# Altium schematic sheet Audi_In.SchDoc
size A4; CompanyName: HEPL; Engineer: CBR; Address1: Quai Gloesener 6; Address2: 4020, liege; SheetNumber: 3; SheetTotal: 5; Version: 1.0
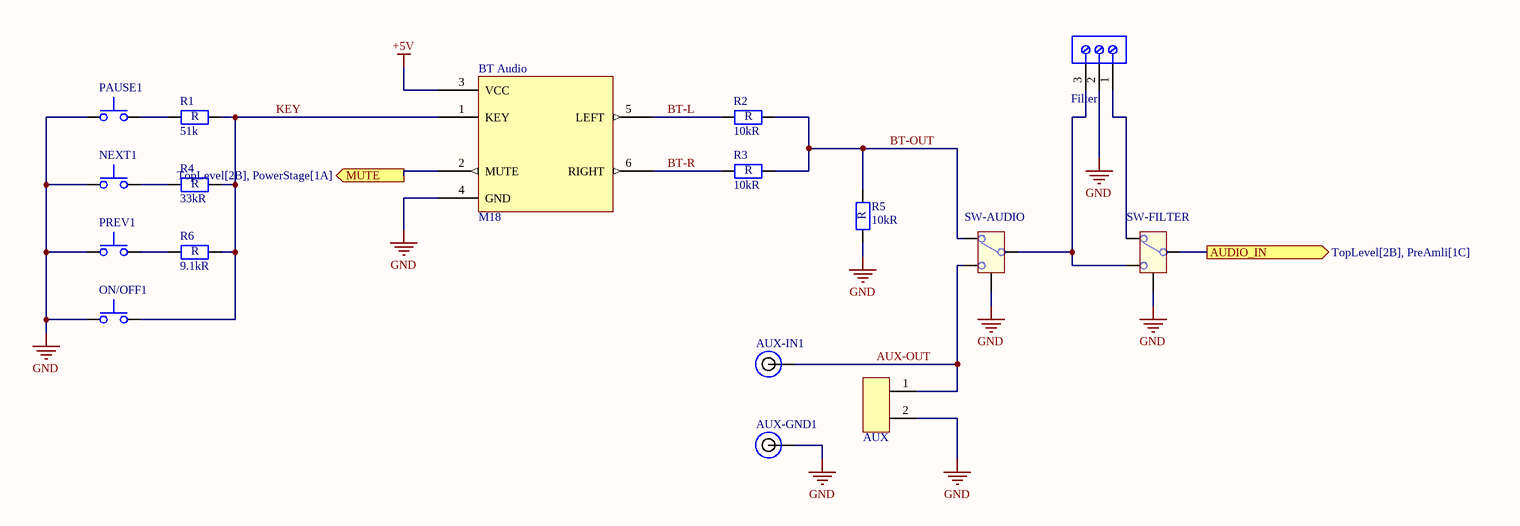
[diagram p0: Audi_In.SchDoc]

## Parts
AUX  (no value)  [TS-75x70]
AUX-GND1  (no value)  [Test Point 1.32mm]
AUX-IN1  (no value)  [Test Point 1.32mm]
BT_Audio  M18  [Bluetooth-M18 flat]
Filter  val?  [691214110003]  (value not drawn)
NEXT1  (no value)  [TackS-35X60]
ON/OFF1  (no value)  [TackS-35X60]
PAUSE1  (no value)  [TackS-35X60]
PREV1  (no value)  [TackS-35X60]
R1  51k  [1206-R]
R2  10kR  [1206-R]
R3  10kR  [1206-R]
R4  33kR  [1206-R]
R5  10kR  [1206-R]
R6  9.1kR  [1206-R]
SW-AUDIO  (no value)  [SPDT-OS102011MS2QN1]
SW-FILTER  (no value)  [SPDT-OS102011MS2QN1]

## Ports
AUDIO_IN (out, see TopLevel[2B], PreAmli[1C]), MUTE (out, see TopLevel[2B], PowerStage[1A])

## Nets
+5V: BT_Audio.3(VCC)
GND: AUX.2 AUX-GND1.1 BT_Audio.4(GND) Filter.2 NEXT1.1 ON/OFF1.1 PAUSE1.1 PREV1.1 R5.1 SW-AUDIO.4(shield) SW-FILTER.4(shield)
AUDIO_IN: SW-FILTER.2(C) ; port AUDIO_IN
AUX-OUT: AUX.1 AUX-IN1.1 SW-AUDIO.3(NO)
BT-L: BT_Audio.5(LEFT) R2.1
BT-OUT: R2.2 R3.2 R5.2 SW-AUDIO.1(NC)
BT-R: BT_Audio.6(RIGHT) R3.1
KEY: BT_Audio.1(KEY) ON/OFF1.2 R1.2 R4.2 R6.2
MUTE: BT_Audio.2(MUTE) ; port MUTE
NetFilter_1: Filter.1 SW-FILTER.1(NC)
NetFilter_3: Filter.3 SW-AUDIO.2(C) SW-FILTER.3(NO)
NetNEXT1_2: NEXT1.2 R4.1
NetPAUSE1_2: PAUSE1.2 R1.1
NetPREV1_2: PREV1.2 R6.1

## Notes on the sheet
- Title :
- HEPL
- Size :
- Date :
- A4
- sheet name :
- Time :
- Sheet
- of
- Engineer :
- Quai Gloesener
- 4020 Liège
- Version :
- (in symbol Resistor) R

## Library data of the parts
AUX = Connector-2: Fixed Terminal Blocks PT 1.5/2-3.5H 2POS HRZ 3.5mm SCREW; Manufacturer: Phoenix Contact; Manufacturer Part Number: 1984617; Supplier: Mouser; Supplier Part Number: 651-1984617; Supplier Unit Price: 0.55; MOQ: 1
AUX-GND1 AUX-IN1 = Test Point: PCB Test Point, Type 8 Series, Black, Through Hole Mount, 1.32 mm, Phosphor Bronze; Manufacturer: VERO; Manufacturer Part Number: 20-2136; Supplier Part Number: 8731195; Supplier: Farnell; Supplier Unit Price: 0.132; MOQ: 100
BT_Audio = M18-Bluetooth: BLUETOOTH AUDIO TRANSFER MODULE; Manufacturer: *; Manufacturer Part Number: *; Supplier: *; Supplier Part Number: *; Supplier Unit Price: *; MOQ: *
Filter = Screw Terminal 3x: Manufacturer: WE; Manufacturer Part Number: 691-214110-003; Supplier: mouser; Supplier Part Number: 710-691214110003; Supplier Unit Price: 1.16; MOQ: 1
NEXT1 ON/OFF1 PAUSE1 PREV1 = TackSwitch Simple: Manufacturer: MULTICOMP PRO; Manufacturer Part Number: DTSM-32S-B; Supplier Part Number: 9471898; Supplier: Farnell; Supplier Unit Price: 0.188; MOQ: 10
R1-R6 = Resistor: Manufacturer: *; Manufacturer Part Number: *; Supplier: *; Supplier Part Number: *; Supplier Unit Price: *; MOQ: *
SW-AUDIO SW-FILTER = SPDT: Slide Switches SPDT On-On; Manufacturer: C&K; Manufacturer Part Number: OS102011MS2QN1; Supplier: Mouser; Supplier Part Number: 611-OS102011MS2QN1; Supplier Unit Price: 0.39; MOQ: 1